# Altium schematic sheet Thermal.SchDoc
size B; SheetNumber: 5; SheetTotal: 6
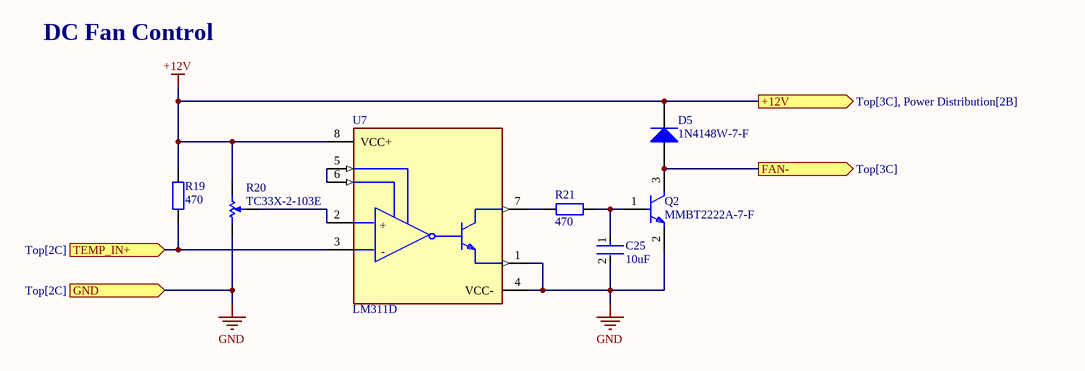
[diagram p0: Thermal.SchDoc]

## Parts
C25  10uF  [FP-GRM21B-0_1-IPC_C]
D5  1N4148W-7-F  [DIOD-SOD123-2_V]
Q2  MMBT2222A-7-F  [FP-SOT23-IPC_A]
R19  470  [IPC C R0402 NO SILK]
R20  TC33X-2-103E  [BOUR-TC33X-2_V]
R21  470  [IPC C R0402 NO SILK]
U7  LM311D  [FP-D0008A-MFG]

## Ports
+12V (out, see Top[3C], Power Distribution[2B]), FAN- (out, see Top[3C]), GND (in, see Top[2C]), TEMP_IN+ (in, see Top[2C])

## Nets
+12V: D5.2(K) R19.1 R20.3 U7.8(VCC+) ; port +12V
GND: C25.2 Q2.2(E) R20.1 U7.1(EMIT_OUT) U7.4(VCC-) ; port GND
FAN-: D5.1(A) Q2.3(C) ; port FAN-
TEMP_IN+: R19.2 U7.3(IN-) ; port TEMP_IN+
NetC25_1: C25.1 Q2.1(B) R21.2
NetR20_2: R20.2 U7.2(IN+)
NetR21_1: R21.1 U7.7(COL_OUT)
NetU7_5: U7.5(BALANCE) U7.6(BAL/STRB)

## Notes on the sheet
- DC Fan Control
- (in symbol CMP-04896-000022-1) +; -

## Library data of the parts
C25 = CMP-2007-03453-2: GRM21BR61C106KE15L; Chip Multilayer Ceramic Capacitors for General Purpose, 0805, 10uF, X5R, 15%, 10%, 16V; Radiation Hardening: No; Thickness: 0.053inch; Voltage Rating (DC): 16V; Lead Free: Lead Free; Package Quantity: 1; Width: 1.25mm; Case Code (Imperial): 0805; Depth: 1.25mm; Packaging: Tape and Reel; Dielectric: X5R; Max Operating Temperature: 85°C; Tolerance: 10%; Voltage Rating: 16V; Voltage: 16V; Capacitance: 10uF; Height: 1.25mm; Case Code (Metric): 2012; Material: Ceramic; Mount: Surface Mount; Case/Package: 0805; REACH SVHC: No SVHC; Length: 2mm; Min Operating Temperature: -55°C; Termination: SMD/SMT
D5 = CMP-2000-04932-2: Fast Switching Diode, 100 V, 0.15 A, -65 to 150 degC, 2-Pin?SOD123, RoHS, Tape and Reel; Recovery Time: 4ns; Brand: DiodesIncorporated; Unit Weight: 0.000353oz; Max Surge Current: 2A; Peak Reverse Voltage: 100V; Ir - Reverse Current: 1uA; Vf - Forward Voltage: 1.25V; Configuration: Single; If - Forward Current: 0.15A; Product Category: Diodes-GeneralPurpose,Power,Switching; Operating Temperature Range: -65Cto+150C; Packaging: Reel; Manufacturer URL: http://www.diodes.com/; Maximum Operating Temperature: +150C; Height: 1.25mm; Minimum Operating Temperature: -65C; Product: SwitchingDiodes; Package URL: http://www.diodes.com/datasheets/ds18004.pdf; Type: SwitchingDiode; Package Reference: SOD123-2; Width: 1.7mm; Datasheet URL: http://www.farnell.com/datasheets/1915529.pdf; Datasheet Version: Rev. 24-2, 10/2013; Series: 1N4148; Factory Pack Quantity: 3000; Length: 2.85mm; RoHS: True; Manufacturer: DiodesIncorporated; Mounting Style: SMD/SMT; Package / Case: SOD-123
Q2 = CMP-1693-00003-4: TRANS NPN 40V 0.6A SMD SOT23-3; Number of Elements: 1; Frequency: 300MHz; Max Collector Current: 600mA; Collector Base Voltage (VCBO): 75V; Current: 1A; Element Configuration: Single; Power Dissipation: 350mW; hFE Min: 100; Collector Emitter Saturation Voltage: 1V; Max Power Dissipation: 300mW; Emitter Base Voltage (VEBO): 6V; Voltage: 40V; Collector Emitter Breakdown Voltage: 40V; Width: 1.4mm; Polarity: NPN; Termination: SMD/SMT; Max Operating Temperature: 150°C; Transition Frequency: 300MHz; Contact Plating: Tin; Mount: Surface Mount; Max Frequency: 300MHz; Case/Package: SOT-23; Gain Bandwidth Product: 300MHz; Lead Free: Lead Free; Collector Emitter Voltage (VCEO): 40V; Radiation Hardening: No; Voltage Rating (DC): 40V; Height: 1mm; Max Breakdown Voltage: 40V; Packaging: Tape and Reel; Length: 3.05mm; Min Operating Temperature: -55°C; Weight: 0.000282oz; Current Rating: 600mA; REACH SVHC: No SVHC; Package Quantity: 3000; Continuous Collector Current: 600mA; Number of Pins: 3
R19 R21 = CMP-008-000000-1: Value: 470; Source: Schlib1.SchLib; Design Item ID: Generic RES 0402
R20 = CMP-2100-03695-1: Trimming Potentiometer, 10000 Ohm, -40 to 100 degC, 3-Pin SMD, RoHS, Tape and Reel; Manufacturer: Bourns; Tolerance: 25%; Max Power Dissipation: 100mW; Number of Turns: 1; Resistance: 10KOhm; Temperature Coefficient: 250ppm/degreesC; Voltage Rating (DC): 50V; Datasheet URL: http://www.bourns.com/docs/Product-Datasheets/TC33.pdf; Composition: Potentiometer; Package Description: 3-Pin Surface Mount Device, Body 3.8 x 3.6 mm; Weight: 29.4mg; Power Rating: 100mW; Termination: FootPrint; Manufacturer URL: http://www.bourns.com/; Width: 0.118inch; Height: 0.047inch; Military Standard: Not; Radiation Hardening: No; Colour: Silver; Case/Package: SMD/SMT; Depth: 3.8mm; Min Operating Temperature: -40degC; Lead Free: LeadFree; Datasheet Version: 42583.0; REACH SVHC: NoSVHC; Length: 3mm; RoHSCompliant: true; Contact Plating: Silver; Taper: Linear; Packaging: TapeandReel; Mount: SurfaceMount; Max Operating Temperature: 100degC; Package Reference: TC33X-2; Package Quantity: 2500
U7 = CMP-04896-000022-1: IC DIFF COMP W/STROBE 8-SOIC; Manufacturer: Texas Instruments; Standoff Height: 0.11mm; Max Junction Temp: +150°C; Voltage Gain: 200V/mV; Input Offset Voltage: 2mV; Min Supply Voltage: 3.5V; Response Time: 165ns; Max Supply Voltage: 30V; Number Of Channels: 1; Input Bias Current: 0.1uA; Nominal Supply Current: 5.1mA; Automotive: No; Temperature Range High: +70°C; Lead Free: Yes; Ambient Temperature Range Low: 0°C; ComponentLink2URL: http://www.ti.com/lit/ds/symlink/lm311.pdf; Ambient Temperature Range High: +70°C; Manufacturer Part Number: LM311D; Package: D0008A; Temperature Range Low: 0°C; RoHS: TRUE; Digikey Description: IC DIFF COMP W/STROBE 8-SOIC; ComponentLink2Description: Datasheet; Temperature: 0°C to +70°C; Height: 1.75mm; Category: IC; Device Class L1: Integrated Circuits (ICs); Ipc Land Pattern Name: SOIC127P600X175-8; Octopart: https://octopart.com/lm311d-texas+instruments-428348; Device Class L3: Comparators; Mouser Description: Analog Comparators Single Channler; Device Class L2: Linear ICs